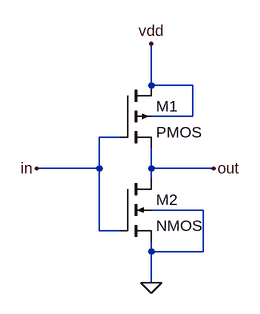
[diagram p0: schematic cmos_inverter_not_gate.asc]
cmos_inverter_not_gate.asc, the LTspice schematic file:
Version 4
SHEET 1 880 680
WIRE 256 80 256 16
WIRE 320 80 256 80
WIRE 320 128 320 80
WIRE 320 128 256 128
WIRE 208 160 176 160
WIRE 176 208 176 160
WIRE 176 208 80 208
WIRE 256 208 256 176
WIRE 352 208 256 208
WIRE 256 224 256 208
WIRE 336 272 256 272
WIRE 176 304 176 208
WIRE 208 304 176 304
WIRE 256 336 256 320
WIRE 336 336 336 272
WIRE 336 336 256 336
WIRE 256 384 256 336
FLAG 256 384 0
FLAG 80 208 in
FLAG 352 208 out
FLAG 256 16 vdd
SYMBOL pmos4 208 80 R0
SYMATTR InstName M1
SYMBOL nmos4 208 224 R0
SYMATTR InstName M2

The netlist it stands for:
* cmos_inverter_not_gate.asc
M1 vdd in out vdd PMOS
M2 out in 0 0 NMOS
.model NMOS NMOS
.model PMOS PMOS
.lib standard.mos
.backanno
.end